# Altium schematic sheet Hdr5.SchDoc
size Letter; SheetNumber: 15; SheetTotal: 15
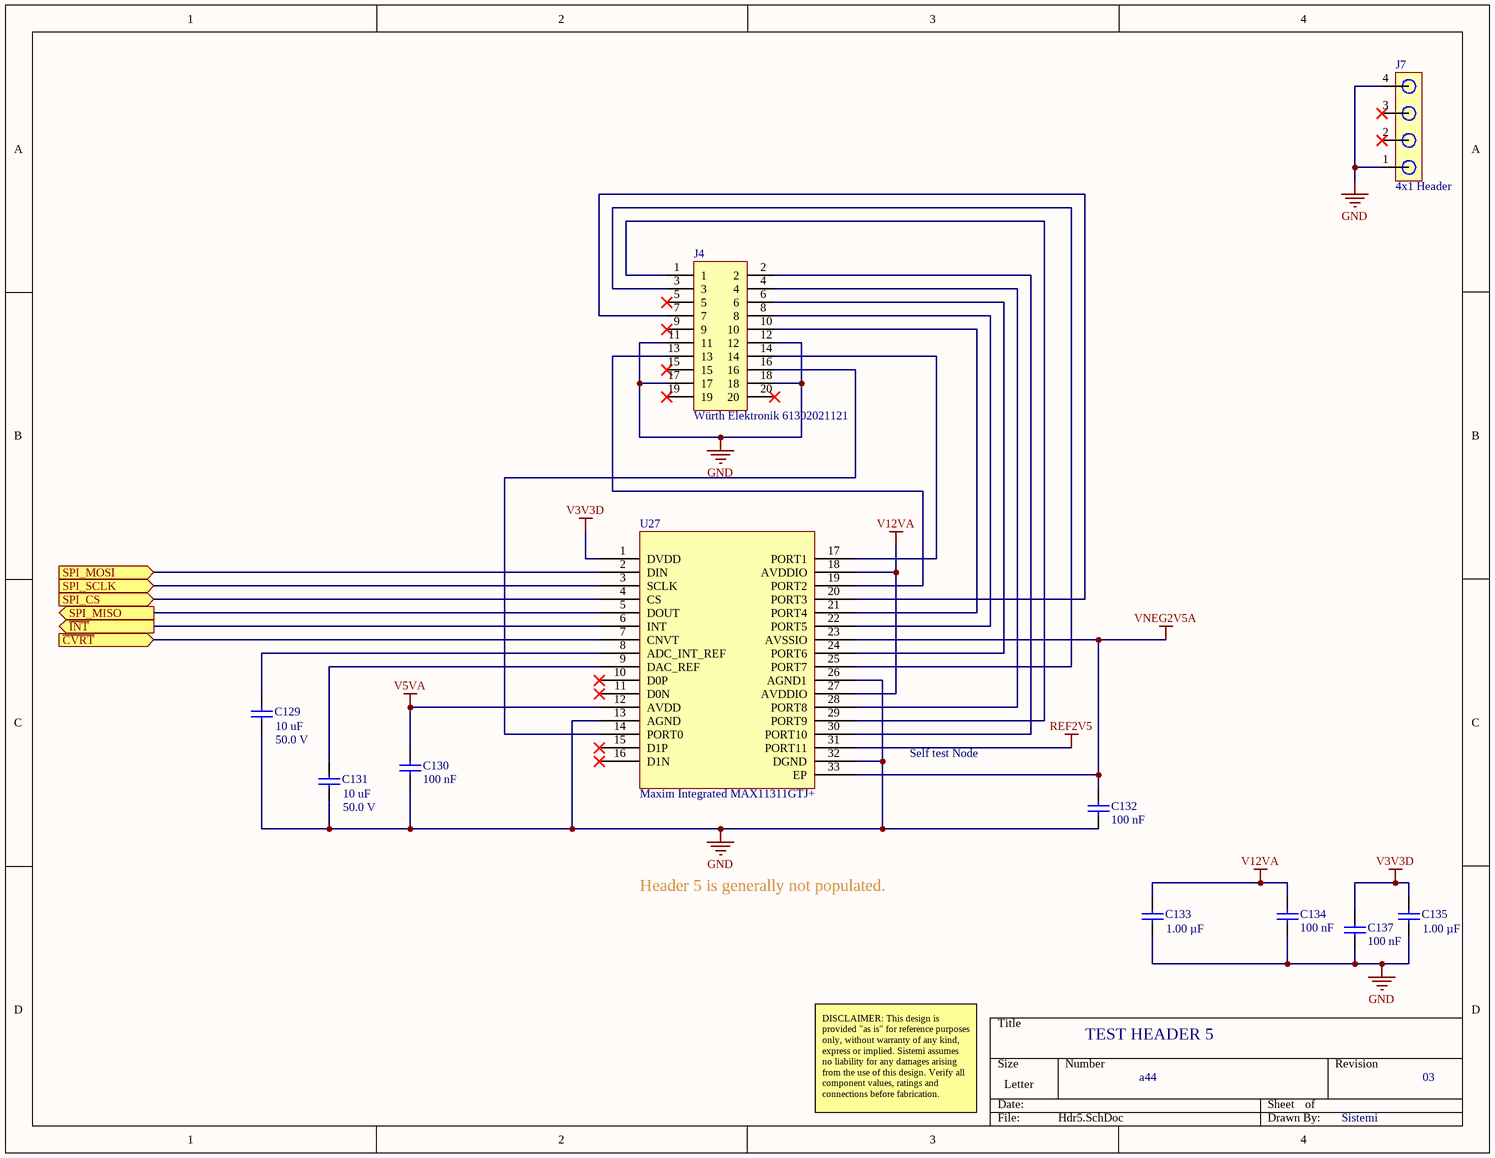
[diagram p0: Hdr5.SchDoc]

## Parts
C129  Capacitance: 10 uF  Voltage Rating (DC): 50.0 V  [CAPC3216X180X55LL20T25]  (hidden comment: Murata GRM31CR61H106KA12L)
C130  Capacitance: 100 nF  [CAPC1005X56X25NL10T15]  (hidden comment: Samsung CL05B104KO5NNNC)
C131  Capacitance: 10 uF  Voltage Rating (DC): 50.0 V  [CAPC3216X180X55LL20T25]  (hidden comment: Murata GRM31CR61H106KA12L)
C132  Capacitance: 100 nF  [CAPC1005X56X25NL10T15]  (hidden comment: Samsung CL05B104KO5NNNC)
C133  Capacitance: 1.00 µF  [CAPC1608X90X35NL15T15]  (hidden comment: Samsung CL10B105KA8NNNC)
C134  Capacitance: 100 nF  [CAPC1005X56X25NL10T15]  (hidden comment: Samsung CL05B104KO5NNNC)
C135  Capacitance: 1.00 µF  [CAPC1608X90X35NL15T15]  (hidden comment: Samsung CL10B105KA8NNNC)
C137  Capacitance: 100 nF  [CAPC1005X56X25NL10T15]  (hidden comment: Samsung CL05B104KO5NNNC)
J4  Würth Elektronik 61302021121  [PCB-nk6cd1c3p7lqby8wsdwb-1]
J7  4x1 Header  [PCB-frzzw7wnfsmgwg7mpl31-1]
U27  Maxim Integrated MAX11311GTJ+  [PCB-s1hzzxkmij8s4b201del-1]

## Ports
SPI_CS (in), SPI_MISO (out), SPI_MOSI (in), SPI_SCLK (in), ~{CVRT} (in), ~{INT} (out)

## Nets
GND: C129.1 C130.2 C131.1 C132.2 C133.1 C134.2 C135.1 C137.2 J4.11 J4.12 J4.17 J4.18 J7.1 J7.4 U27.13(AGND) U27.26(AGND1) U27.32(DGND)
REF2V5: U27.31(PORT11)
V3V3D: C135.2 C137.1 U27.1(DVDD)
V5VA: C130.1 U27.12(AVDD)
V12VA: C133.2 C134.1 U27.18(AVDDIO) U27.27(AVDDIO)
VNEG2V5A: C132.1 U27.23(AVSSIO) U27.33(EP)
~{CVRT}: U27.7(CNVT) ; port ~{CVRT}
~{INT}: U27.6(INT) ; port ~{INT}
SPI_CS: U27.4(CS) ; port SPI_CS
SPI_MISO: U27.5(DOUT) ; port SPI_MISO
SPI_MOSI: U27.2(DIN) ; port SPI_MOSI
SPI_SCLK: U27.3(SCLK) ; port SPI_SCLK
NetC129_2: C129.2 U27.8(ADC_INT_REF)
NetC131_2: C131.2 U27.9(DAC_REF)
NetJ4_1: J4.1 U27.29(PORT9)
NetJ4_2: J4.2 U27.30(PORT10)
NetJ4_3: J4.3 U27.25(PORT7)
NetJ4_4: J4.4 U27.28(PORT8)
NetJ4_6: J4.6 U27.24(PORT6)
NetJ4_7: J4.7 U27.20(PORT3)
NetJ4_8: J4.8 U27.22(PORT5)
NetJ4_10: J4.10 U27.21(PORT4)
NetJ4_13: J4.13 U27.19(PORT2)
NetJ4_14: J4.14 U27.17(PORT1)
NetJ4_16: J4.16 U27.14(PORT0)

Not connected (* = marked no-connect by the designer): J4 5* 9* 15* 19* 20*; J7 2* 3*; U27 10(D0P)* 11(D0N)* 15(D1P)* 16(D1N)*

## Notes on the sheet
- Self test Node
- Header 5 is generally not populated.
- TEST HEADER 5
- DISCLAIMER: This design is provided "as is" for reference purposes only, without warranty of any kind, express or implied. Sistemi assumes no liability for any damages arising from the use of this design. Verify all component values, ratings and connections before fabrication.
- a44
- 03
- Sistemi

## Library data of the parts
C129 C131 = CMP-3554908-2: Multilayer Ceramic Capacitors MLCC - SMD/SMT 1206 10uF 50volt X5R +/-10%; Manufacturer Part Number: CL31B106KBHNNNE; Capacitance Tolerance: ±10%; Case/Package (SI): 3216; Lead-Free Status: Lead Free; Dielectric Characteristic: X5R; Lifecycle Status: Active; Mounting Style: Surface Mount; Number of Pins: 2; Octopart Url: https://octopart.com/grm31cr61h106ka12l-murata-18903335; OctopartID: fd8535afa9c42242; Packaging: Cut Tape (CT); REACH SVHC Compliance: No SVHC; RoHS: Compliant; Size-Length: 0.0032 m; Size-Thickness: 0.0016 m; Size-Width: 0.0016 m
C130 C132 C134 C137 = CMP-bf2276a55d9a60e5-19: Ceramic capacitor SMD-0402 100nF /16V X7R# K +-10%, Samsung, RoHS; Dielectric Characteristic: X7R; Lead-Free Status: Lead Free; Voltage Rating (DC): 16.0 V; Capacitance Tolerance: ±10%; Mounting Style: Surface Mount; Case/Package: 0402; OctopartID: 0755ced2c795d892; Footprint: PCB-0002-00476-3; Octopart URL: https://octopart.com/cl05b104ko5nnnc-samsung-9299366; RoHS: Compliant; Manufacturer Part Number: CL05B104KO5NNNC
C133 C135 = CMP-7473528-5: CL Series 0603 1 uF 25 V ±10 % X7R Surface Mount Multilayer Ceramic Capacitor; Manufacturer Part Number: UMK107AB7105KA-T; Lead-Free Status: Lead Free; Capacitance Tolerance: ±10%; Voltage Rating (DC): 25.0 V; RoHS: Compliant; Mounting Style: Surface Mount; Footprint: PCB-0002-00062-3; Octopart URL: http://octopart.com/cl10b105ka8nnnc-samsung-19831597; Case/Package: 0603; OctopartID: ce7a065e703111bd; Dielectric Characteristic: X7R
J4 = CMP-005cc8a3733edf9b-7: THT Vertical Pin Header WR-PHD, Pitch 2.54 mm, Dual Row, 20 pins; Current Rating: 3.00 A; Dielectric Withstanding Voltage: 500 V; Pin Pitch: 2.54 mm; Operating Voltage: 250 V; Number of Contacts: 20; Contact Resistance: 20.0 mΩ; Gender: Male; Contact Material: Copper; Footprint: PCB-005cc8a3733edf9b-1; Mounting Style: Through Hole; Color: Black; Contact Plating: Gold; REACH SVHC Compliance: No SVHC; RoHS: Compliant; Octopart URL: https://octopart.com/61302021121-w%C3%BCrth+elektronik-32855556; Packaging: Bag; Orientation: Vertical; OctopartID: 005cc8a3733edf9b; Number of Pins: 20; Operating Temperature: -40.0 °C (min); Manufacturer Part Number: 61302021121
J7 = CMP-2ffce6f22d89f03b-6: 2.54mm 100mil header; Manufacturer Part Number: TSW-102-07-G-D; Number of Positions: 4; Gender: Male; Lead-Free Status: Lead Free; OctopartID: 2ffce6f22d89f03b; Pin Pitch: 2.54 mm; REACH SVHC Compliance: No SVHC; Packaging: Bulk; Color: Black; Octopart URL: https://octopart.com/tsw-102-07-g-d-samtec-272147; Contact Plating: Gold; Size-Width: 5.08 mm; Mounting Style: Through Hole; Size-Height: 2.54 mm; Housing Color: Black; Size-Length: 5.08 mm; Operating Temperature: 125 °C (max); Number of Contacts: 4; Housing Material: Plastic; RoHS: Compliant; Contact Material: Phosphor Bronze; Number of Rows: 2
U27 = CMP-2cd8e1e00624f31f-4: 12-channel 12-Bit ADC and 12-Bit DAC, Analog PIXI, 12-Port Programmable Mixed-Signal I/O; Channels: 12; Lead-Free Status: Lead Free; Sample Rate: 400 kHz; Range Options: 0 to 2.5V, ±5V, 0 to +10V, -10V; Supply Voltage (DC): 4.75 V (max), 5.25 V (min); Manufacturer Part Number: MAX11311GTJ+; Lifecycle Status: Not Listed by Manufacturer; Octopart URL: http://octopart.com/max11311gtj%2B-maxim+integrated-70389658; RoHS: Compliant; Number of Bits: 12; OctopartID: 2cd8e1e00624f31f; Package: TQFN-32; Resolution: 12-bit